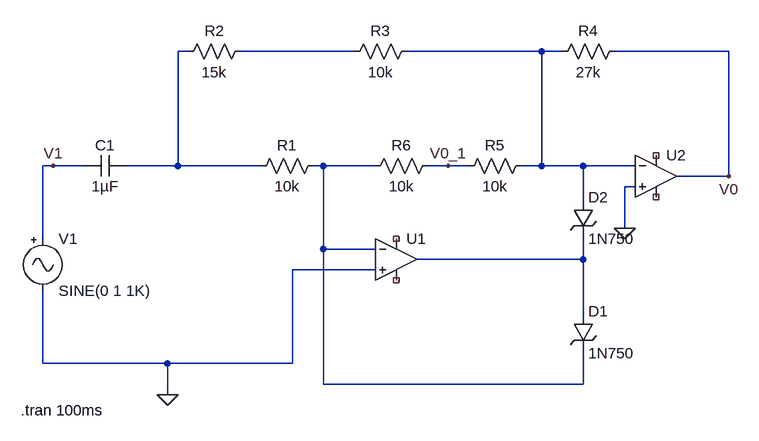
[diagram p0: schematic 5.5.asc]
5.5.asc, the LTspice schematic file:
Version 4
SHEET 1 1104 680
WIRE 240 -128 224 -128
WIRE 496 -128 320 -128
WIRE 784 -128 576 -128
WIRE 816 -128 784 -128
WIRE 1072 -128 896 -128
WIRE 32 48 16 48
WIRE 80 48 32 48
WIRE 224 48 224 -128
WIRE 224 48 144 48
WIRE 352 48 224 48
WIRE 448 48 432 48
WIRE 528 48 448 48
WIRE 640 48 608 48
WIRE 672 48 640 48
WIRE 784 48 784 -128
WIRE 784 48 752 48
WIRE 848 48 784 48
WIRE 928 48 848 48
WIRE 1072 64 1072 -128
WIRE 1072 64 992 64
WIRE 928 80 912 80
WIRE 848 96 848 48
WIRE 912 144 912 80
WIRE 16 160 16 48
WIRE 448 176 448 48
WIRE 528 176 448 176
WIRE 848 192 848 160
WIRE 848 192 592 192
WIRE 528 208 400 208
WIRE 848 272 848 192
WIRE 16 352 16 240
WIRE 208 352 16 352
WIRE 400 352 400 208
WIRE 400 352 208 352
WIRE 448 384 448 176
WIRE 848 384 848 336
WIRE 848 384 448 384
WIRE 208 400 208 352
FLAG 912 144 0
FLAG 208 400 0
FLAG 1072 64 V0
FLAG 640 48 V0_1
FLAG 32 48 V1
SYMBOL Misc\\signal 16 144 R0
SYMATTR InstName V1
SYMBOL cap 144 32 R90
WINDOW 0 0 32 VBottom 2
WINDOW 3 32 32 VTop 2
SYMATTR InstName C1
SYMATTR Value 1µF
SYMBOL res 448 32 R90
WINDOW 0 0 56 VBottom 2
WINDOW 3 32 56 VTop 2
SYMATTR InstName R1
SYMATTR Value 10k
SYMBOL res 336 -144 R90
WINDOW 0 0 56 VBottom 2
WINDOW 3 32 56 VTop 2
SYMATTR InstName R2
SYMATTR Value 15k
SYMBOL res 592 -144 R90
WINDOW 0 0 56 VBottom 2
WINDOW 3 32 56 VTop 2
SYMATTR InstName R3
SYMATTR Value 10k
SYMBOL res 912 -144 R90
WINDOW 0 0 56 VBottom 2
WINDOW 3 32 56 VTop 2
SYMATTR InstName R4
SYMATTR Value 27k
SYMBOL res 768 32 R90
WINDOW 0 0 56 VBottom 2
WINDOW 3 32 56 VTop 2
SYMATTR InstName R5
SYMATTR Value 10k
SYMBOL OpAmps\\UniversalOpAmp2 560 192 R0
SYMATTR InstName U1
SYMBOL res 624 32 R90
WINDOW 0 0 56 VBottom 2
WINDOW 3 32 56 VTop 2
SYMATTR InstName R6
SYMATTR Value 10k
SYMBOL OpAmps\\UniversalOpAmp2 960 64 R0
SYMATTR InstName U2
SYMBOL zener 832 272 R0
SYMATTR InstName D1
SYMATTR Value 1N750
SYMATTR Description Diode
SYMATTR Type diode
SYMBOL zener 832 96 R0
SYMATTR InstName D2
SYMATTR Value 1N750
SYMATTR Description Diode
SYMATTR Type diode
TEXT -18 424 Left 2 !.tran 100ms

The netlist it stands for:
* 5.5.asc
V1 V1 0 SINE(0 1 1K)
C1 N001 V1 1µF
R1 N004 N001 10k
R2 N002 N001 15k
R3 N003 N002 10k
R4 V0 N003 27k
R5 N003 V0_1 10k
XU1 0 N004 NC_01 NC_02 N005 level2 Avol=1Meg GBW=10Meg Slew=10Meg Ilimit=25m Rail=0 Vos=0 En=0 Enk=0 In=0 Ink=0 Rin=500Meg  ; pins In+ In- V+ V- OUT
R6 V0_1 N004 10k
XU2 0 N003 NC_03 NC_04 V0 level2 Avol=1Meg GBW=10Meg Slew=10Meg Ilimit=25m Rail=0 Vos=0 En=0 Enk=0 In=0 Ink=0 Rin=500Meg  ; pins In+ In- V+ V- OUT
D1 N005 N004 1N750
D2 N003 N005 1N750
.model D D
.lib standard.dio
.tran 100ms
.lib UniversalOpAmp2.lib
.backanno
.end